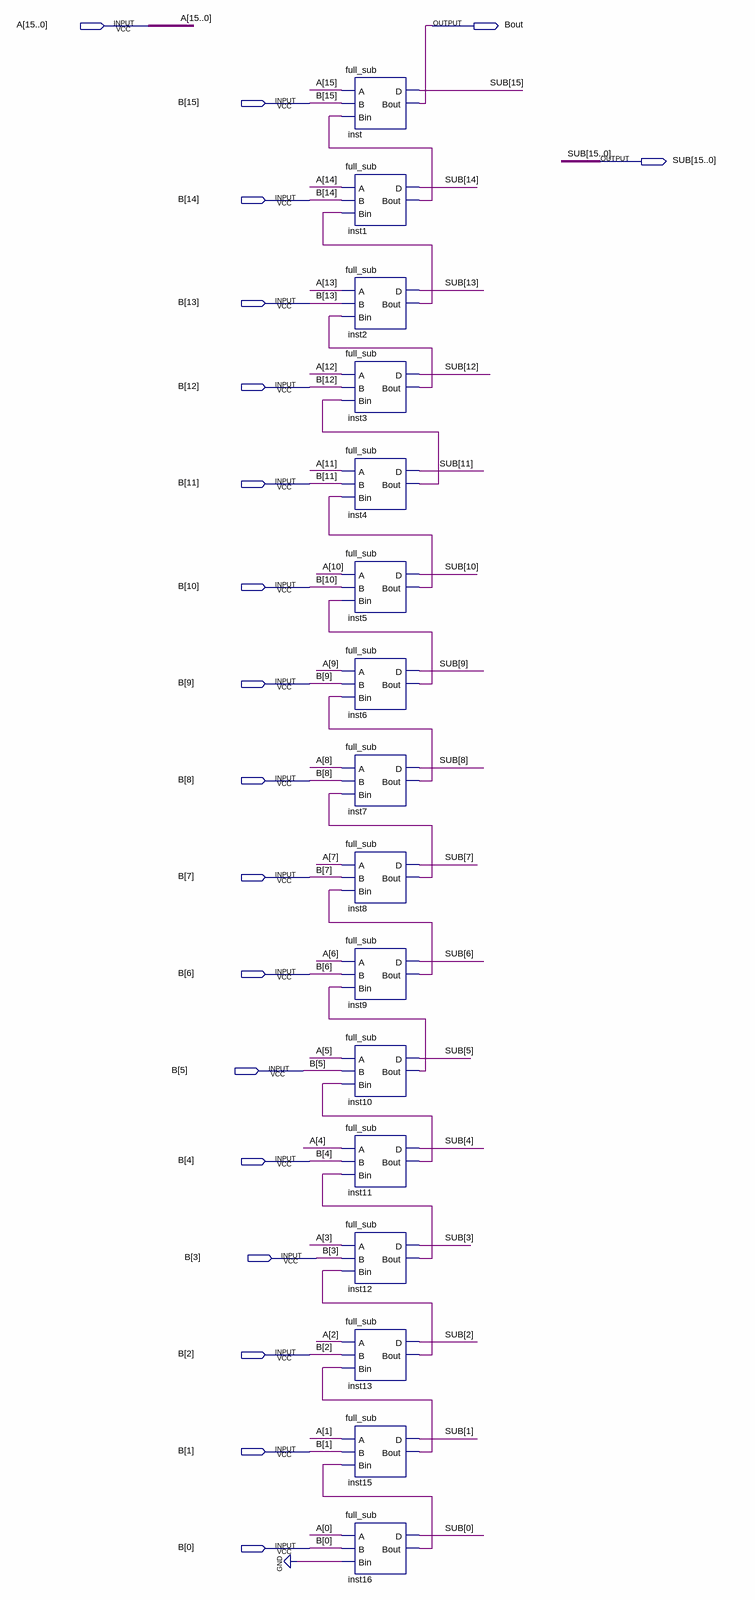
[diagram p0: schematic sheet]
// Quartus schematic full_sub_16bit.bdf as structural Verilog: 16 symbols, 19 pins
module full_sub_16bit (
  input  [15:0] A,
  input  [15:0] B,
  output Bout,
  output [15:0] SUB
);

  wire inst1_bout, inst2_bout, inst3_bout, inst4_bout, inst5_bout, inst6_bout, inst7_bout, inst8_bout,
       inst9_bout, inst10_bout, inst11_bout, inst12_bout, inst13_bout, inst15_bout, inst16_bout;

  full_sub inst (.A(A[15]), .B(B[15]), .Bin(inst1_bout), .D(SUB[15]), .Bout(Bout));
  full_sub inst1 (.A(A[14]), .B(B[14]), .Bin(inst2_bout), .D(SUB[14]), .Bout(inst1_bout));
  full_sub inst2 (.A(A[13]), .B(B[13]), .Bin(inst3_bout), .D(SUB[13]), .Bout(inst2_bout));
  full_sub inst3 (.A(A[12]), .B(B[12]), .Bin(inst4_bout), .D(SUB[12]), .Bout(inst3_bout));
  full_sub inst4 (.A(A[11]), .B(B[11]), .Bin(inst5_bout), .D(SUB[11]), .Bout(inst4_bout));
  full_sub inst5 (.A(A[10]), .B(B[10]), .Bin(inst6_bout), .D(SUB[10]), .Bout(inst5_bout));
  full_sub inst6 (.A(A[9]), .B(B[9]), .Bin(inst7_bout), .D(SUB[9]), .Bout(inst6_bout));
  full_sub inst7 (.A(A[8]), .B(B[8]), .Bin(inst8_bout), .D(SUB[8]), .Bout(inst7_bout));
  full_sub inst8 (.A(A[7]), .B(B[7]), .Bin(inst9_bout), .D(SUB[7]), .Bout(inst8_bout));
  full_sub inst9 (.A(A[6]), .B(B[6]), .Bin(inst10_bout), .D(SUB[6]), .Bout(inst9_bout));
  full_sub inst10 (.A(A[5]), .B(B[5]), .Bin(inst11_bout), .D(SUB[5]), .Bout(inst10_bout));
  full_sub inst11 (.A(A[4]), .B(B[4]), .Bin(inst12_bout), .D(SUB[4]), .Bout(inst11_bout));
  full_sub inst12 (.A(A[3]), .B(B[3]), .Bin(inst13_bout), .D(SUB[3]), .Bout(inst12_bout));
  full_sub inst13 (.A(A[2]), .B(B[2]), .Bin(inst15_bout), .D(SUB[2]), .Bout(inst13_bout));
  full_sub inst15 (.A(A[1]), .B(B[1]), .Bin(inst16_bout), .D(SUB[1]), .Bout(inst15_bout));
  full_sub inst16 (.A(A[0]), .B(B[0]), .Bin(1'b0), .D(SUB[0]), .Bout(inst16_bout));
endmodule
